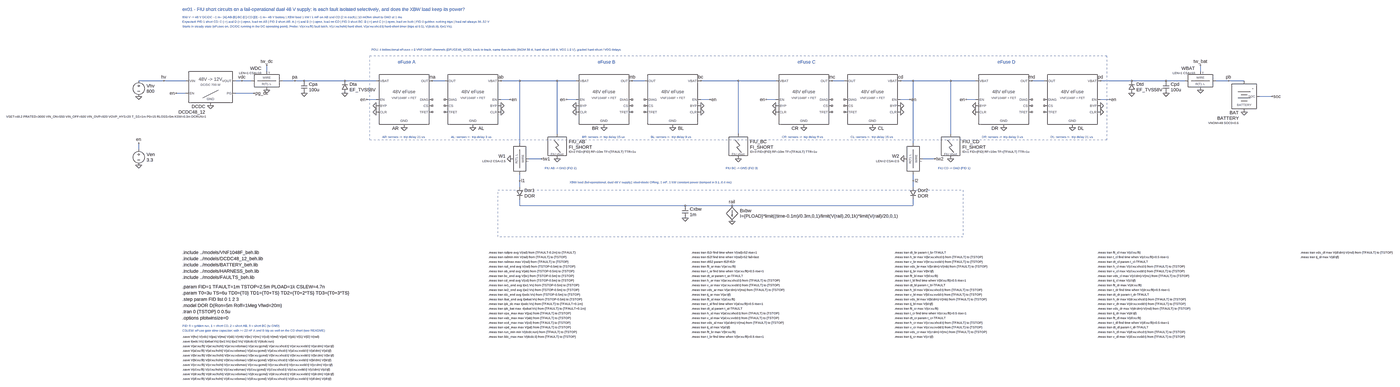
[diagram p0: schematic ex01_fiu_short_selectivity.asc, whole sheet]
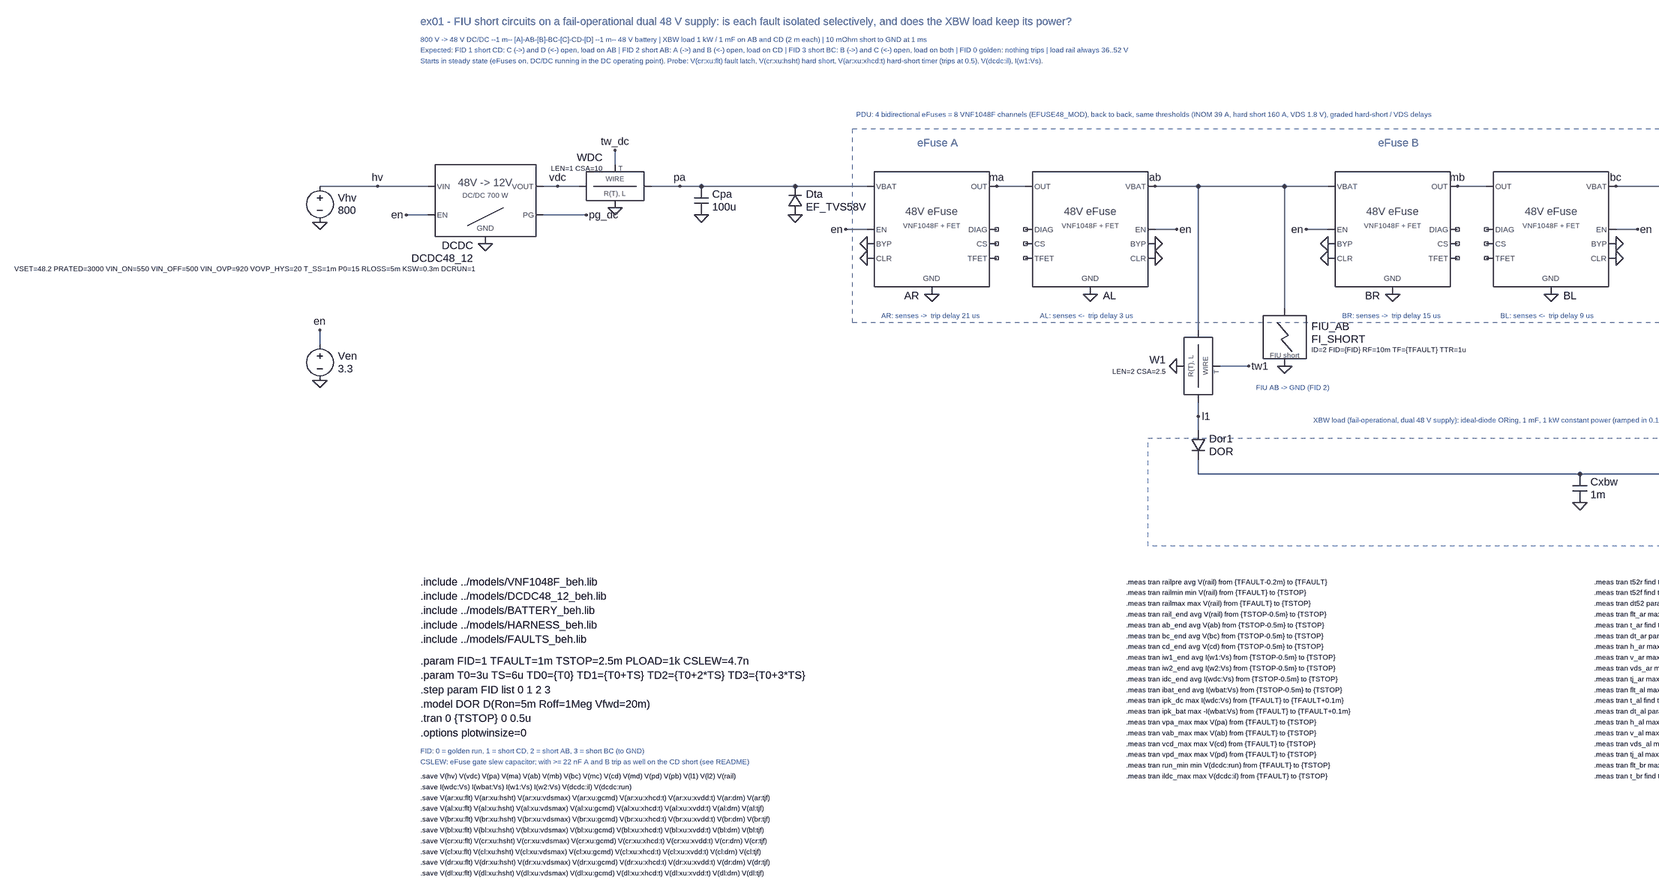
[diagram p1: schematic ex01_fiu_short_selectivity.asc, part, row 1 of 1, column 1 of 2]
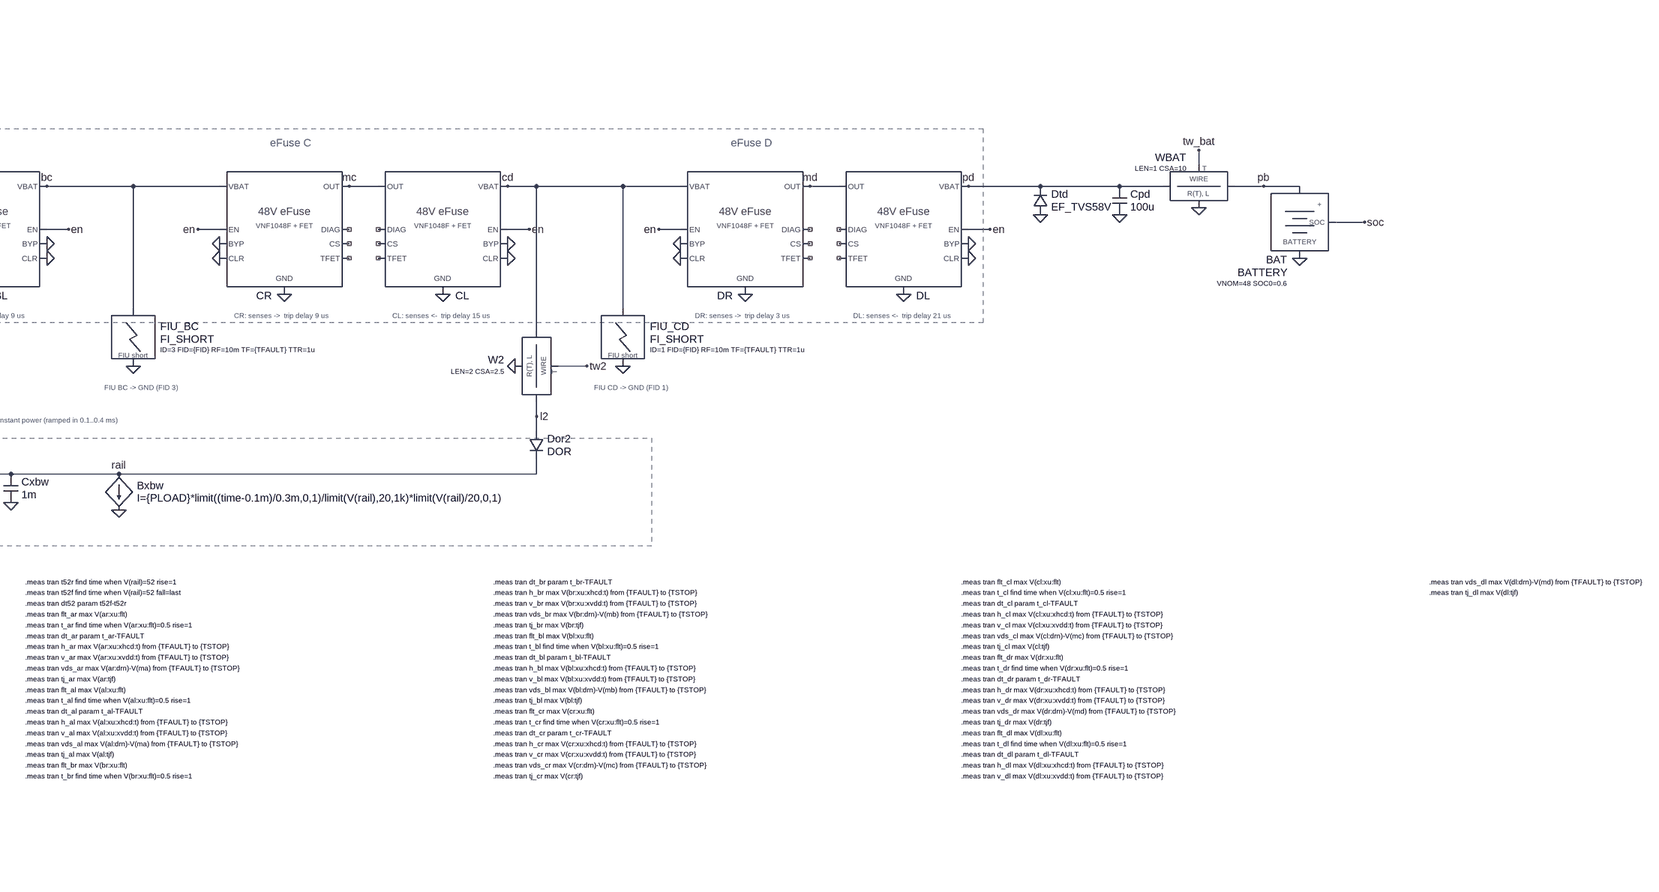
[diagram p2: schematic ex01_fiu_short_selectivity.asc, part, row 1 of 1, column 2 of 2]
ex01_fiu_short_selectivity.asc, the LTspice schematic file:
Version 4
SHEET 1 5600 1900
SYMBOL voltage -192 304 R0
WINDOW 0 40 42 Left 2
WINDOW 3 40 70 Left 2
SYMATTR InstName Vhv
SYMATTR Value 800
SYMATTR SpiceLine Rser=50m
FLAG -192 400 0
SYMBOL DCDC48_12 176 352 R0
SYMATTR InstName DCDC
SYMATTR SpiceLine VSET=48.2 PRATED=3000 VIN_ON=550 VIN_OFF=500 VIN_OVP=920 VOVP_HYS=20 T_SS=1m P0=15 RLOSS=5m KSW=0.3m DCRUN=1
WIRE -192 320 -64 320
WIRE -64 320 48 320
FLAG -64 320 hv
FLAG 176 448 0
WIRE 48 384 0 384
FLAG 0 384 en
WIRE 304 384 400 384
FLAG 400 384 pg_dc
SYMBOL WIRE 464 320 R0
SYMATTR InstName WDC
SYMATTR SpiceLine LEN=1 CSA=10
WINDOW 0 -28 -64 Right 2
WINDOW 3 0 0 Invisible 2
WINDOW 39 -28 -40 Right 1
WIRE 304 320 336 320
WIRE 336 320 384 320
FLAG 336 320 vdc
WIRE 464 272 464 240
FLAG 464 240 tw_dc
FLAG 464 368 0
SYMBOL cap 640 320 R0
WINDOW 0 40 18 Left 2
WINDOW 3 40 46 Left 2
SYMATTR InstName Cpa
SYMATTR Value 100u
SYMATTR SpiceLine Rser=30m
FLAG 656 384 0
SYMBOL diode 880 384 R180
WINDOW 0 -8 46 Right 2
WINDOW 3 -8 18 Right 2
SYMATTR InstName Dta
SYMATTR Value EF_TVS58V
FLAG 864 384 0
WIRE 544 320 608 320
WIRE 608 320 656 320
FLAG 608 320 pa
WIRE 656 320 864 320
SYMBOL EFUSE48_MOD 1168 416 R0
SYMATTR InstName AR
SYMATTR SpiceLine OVC_CODE=22 HSC_CODE=15 VDS_CODE=30 C_SLEW={CSLEW} HSC_DLY={TD3} VDS_DLY={TD3}
WINDOW 39 0 0 Invisible 2
WINDOW 3 0 0 Invisible 2
FLAG 1168 560 0
WIRE 1024 416 976 416
FLAG 976 416 en
FLAG 1024 448 0
FLAG 1024 480 0
TEXT 1056 608 Left 1 ;AR: senses ->  trip delay 21 us
SYMBOL EFUSE48_MOD 1520 416 M0
SYMATTR InstName AL
SYMATTR SpiceLine OVC_CODE=22 HSC_CODE=15 VDS_CODE=30 C_SLEW={CSLEW} HSC_DLY={TD0} VDS_DLY={TD0}
WINDOW 39 0 0 Invisible 2
WINDOW 3 0 0 Invisible 2
FLAG 1520 560 0
WIRE 1664 416 1712 416
FLAG 1712 416 en
FLAG 1664 448 0
FLAG 1664 480 0
TEXT 1408 608 Left 1 ;AL: senses <-  trip delay 3 us
WIRE 1312 320 1376 320
FLAG 1312 320 ma
WIRE 864 320 1024 320
FLAG 1664 320 ab
TEXT 1136 224 Left 2 ;eFuse A
SYMBOL EFUSE48_MOD 2192 416 R0
SYMATTR InstName BR
SYMATTR SpiceLine OVC_CODE=22 HSC_CODE=15 VDS_CODE=30 C_SLEW={CSLEW} HSC_DLY={TD2} VDS_DLY={TD2}
WINDOW 39 0 0 Invisible 2
WINDOW 3 0 0 Invisible 2
FLAG 2192 560 0
WIRE 2048 416 2000 416
FLAG 2000 416 en
FLAG 2048 448 0
FLAG 2048 480 0
TEXT 2080 608 Left 1 ;BR: senses ->  trip delay 15 us
SYMBOL EFUSE48_MOD 2544 416 M0
SYMATTR InstName BL
SYMATTR SpiceLine OVC_CODE=22 HSC_CODE=15 VDS_CODE=30 C_SLEW={CSLEW} HSC_DLY={TD1} VDS_DLY={TD1}
WINDOW 39 0 0 Invisible 2
WINDOW 3 0 0 Invisible 2
FLAG 2544 560 0
WIRE 2688 416 2736 416
FLAG 2736 416 en
FLAG 2688 448 0
FLAG 2688 480 0
TEXT 2432 608 Left 1 ;BL: senses <-  trip delay 9 us
WIRE 2336 320 2400 320
FLAG 2336 320 mb
WIRE 1664 320 2048 320
FLAG 2688 320 bc
TEXT 2160 224 Left 2 ;eFuse B
SYMBOL EFUSE48_MOD 3216 416 R0
SYMATTR InstName CR
SYMATTR SpiceLine OVC_CODE=22 HSC_CODE=15 VDS_CODE=30 C_SLEW={CSLEW} HSC_DLY={TD1} VDS_DLY={TD1}
WINDOW 39 0 0 Invisible 2
WINDOW 3 0 0 Invisible 2
FLAG 3216 560 0
WIRE 3072 416 3024 416
FLAG 3024 416 en
FLAG 3072 448 0
FLAG 3072 480 0
TEXT 3104 608 Left 1 ;CR: senses ->  trip delay 9 us
SYMBOL EFUSE48_MOD 3568 416 M0
SYMATTR InstName CL
SYMATTR SpiceLine OVC_CODE=22 HSC_CODE=15 VDS_CODE=30 C_SLEW={CSLEW} HSC_DLY={TD2} VDS_DLY={TD2}
WINDOW 39 0 0 Invisible 2
WINDOW 3 0 0 Invisible 2
FLAG 3568 560 0
WIRE 3712 416 3760 416
FLAG 3760 416 en
FLAG 3712 448 0
FLAG 3712 480 0
TEXT 3456 608 Left 1 ;CL: senses <-  trip delay 15 us
WIRE 3360 320 3424 320
FLAG 3360 320 mc
WIRE 2688 320 3072 320
FLAG 3712 320 cd
TEXT 3184 224 Left 2 ;eFuse C
SYMBOL EFUSE48_MOD 4240 416 R0
SYMATTR InstName DR
SYMATTR SpiceLine OVC_CODE=22 HSC_CODE=15 VDS_CODE=30 C_SLEW={CSLEW} HSC_DLY={TD0} VDS_DLY={TD0}
WINDOW 39 0 0 Invisible 2
WINDOW 3 0 0 Invisible 2
FLAG 4240 560 0
WIRE 4096 416 4048 416
FLAG 4048 416 en
FLAG 4096 448 0
FLAG 4096 480 0
TEXT 4128 608 Left 1 ;DR: senses ->  trip delay 3 us
SYMBOL EFUSE48_MOD 4592 416 M0
SYMATTR InstName DL
SYMATTR SpiceLine OVC_CODE=22 HSC_CODE=15 VDS_CODE=30 C_SLEW={CSLEW} HSC_DLY={TD3} VDS_DLY={TD3}
WINDOW 39 0 0 Invisible 2
WINDOW 3 0 0 Invisible 2
FLAG 4592 560 0
WIRE 4736 416 4784 416
FLAG 4784 416 en
FLAG 4736 448 0
FLAG 4736 480 0
TEXT 4480 608 Left 1 ;DL: senses <-  trip delay 21 us
WIRE 4384 320 4448 320
FLAG 4384 320 md
WIRE 3712 320 4096 320
FLAG 4736 320 pd
TEXT 4208 224 Left 2 ;eFuse D
WIRE 4736 320 4864 320
RECTANGLE Normal 4768 624 992 192 2
TEXT 1000 160 Left 1 ;PDU: 4 bidirectional eFuses = 8 VNF1048F channels (EFUSE48_MOD), back to back, same thresholds (INOM 39 A, hard short 160 A, VDS 1.8 V), graded hard-short / VDS delays
SYMBOL diode 4912 384 R180
WINDOW 0 -8 46 Right 2
WINDOW 3 -8 18 Right 2
SYMATTR InstName Dtd
SYMATTR Value EF_TVS58V
FLAG 4896 384 0
SYMBOL cap 5056 320 R0
WINDOW 0 40 18 Left 2
WINDOW 3 40 46 Left 2
SYMATTR InstName Cpd
SYMATTR Value 100u
SYMATTR SpiceLine Rser=30m
FLAG 5072 384 0
SYMBOL WIRE 5248 320 R0
SYMATTR InstName WBAT
SYMATTR SpiceLine LEN=1 CSA=10
WINDOW 0 -28 -64 Right 2
WINDOW 3 0 0 Invisible 2
WINDOW 39 -28 -40 Right 1
WIRE 4864 320 4896 320
WIRE 4896 320 5072 320
WIRE 5072 320 5168 320
WIRE 5248 272 5248 240
FLAG 5248 240 tw_bat
FLAG 5248 368 0
SYMBOL BATTERY 5472 400 R0
SYMATTR InstName BAT
SYMATTR SpiceLine VNOM=48 SOC0=0.6
WIRE 5328 320 5392 320
WIRE 5392 320 5472 320
FLAG 5392 320 pb
FLAG 5472 480 0
WIRE 5552 400 5616 400
FLAG 5616 400 soc
WIRE 1760 320 1760 640
SYMBOL WIRE 1760 720 R90
SYMATTR InstName W1
SYMATTR SpiceLine LEN=2 CSA=2.5
WINDOW 0 -14 72 VRight 2
WINDOW 3 0 0 Invisible 2
WINDOW 39 12 72 VRight 1
WIRE 1808 720 1872 720
FLAG 1872 720 tw1
FLAG 1712 720 0
SYMBOL diode 1744 864 R0
WINDOW 0 40 18 Left 2
WINDOW 3 40 46 Left 2
SYMATTR InstName Dor1
SYMATTR Value DOR
WIRE 1760 800 1760 832
WIRE 1760 832 1760 864
FLAG 1760 832 l1
WIRE 3776 320 3776 640
SYMBOL WIRE 3776 720 R90
SYMATTR InstName W2
SYMATTR SpiceLine LEN=2 CSA=2.5
WINDOW 0 -14 72 VRight 2
WINDOW 3 0 0 Invisible 2
WINDOW 39 12 72 VRight 1
WIRE 3824 720 3888 720
FLAG 3888 720 tw2
FLAG 3728 720 0
SYMBOL diode 3760 864 R0
WINDOW 0 40 18 Left 2
WINDOW 3 40 46 Left 2
SYMATTR InstName Dor2
SYMATTR Value DOR
WIRE 3776 800 3776 832
WIRE 3776 832 3776 864
FLAG 3776 832 l2
WIRE 1760 928 1760 960
WIRE 1760 960 3776 960
WIRE 3776 960 3776 928
FLAG 2848 960 rail
SYMBOL cap 2592 960 R0
WINDOW 0 40 18 Left 2
WINDOW 3 40 46 Left 2
SYMATTR InstName Cxbw
SYMATTR Value 1m
SYMATTR SpiceLine Rser=10m
FLAG 2608 1024 0
SYMBOL bi 2848 960 R0
WINDOW 0 40 26 Left 2
WINDOW 3 40 54 Left 2
SYMATTR InstName Bxbw
SYMATTR Value I={PLOAD}*limit((time-0.1m)/0.3m,0,1)/limit(V(rail),20,1k)*limit(V(rail)/20,0,1)
FLAG 2848 1040 0
RECTANGLE Normal 4032 1120 1648 880 2
TEXT 2016 840 Left 1 ;XBW load (fail-operational, dual 48 V supply): ideal-diode ORing, 1 mF, 1 kW constant power (ramped in 0.1..0.4 ms)
WIRE 1952 320 1952 592
SYMBOL FI_SHORT 1952 656 R0
SYMATTR InstName FIU_AB
SYMATTR SpiceLine ID=2 FID={FID} RF=10m TF={TFAULT} TTR=1u
FLAG 1952 720 0
TEXT 1888 768 Left 1 ;FIU AB -> GND (FID 2)
WIRE 2880 320 2880 592
SYMBOL FI_SHORT 2880 656 R0
SYMATTR InstName FIU_BC
SYMATTR SpiceLine ID=3 FID={FID} RF=10m TF={TFAULT} TTR=1u
FLAG 2880 720 0
TEXT 2816 768 Left 1 ;FIU BC -> GND (FID 3)
WIRE 3968 320 3968 592
SYMBOL FI_SHORT 3968 656 R0
SYMATTR InstName FIU_CD
SYMATTR SpiceLine ID=1 FID={FID} RF=10m TF={TFAULT} TTR=1u
FLAG 3968 720 0
TEXT 3904 768 Left 1 ;FIU CD -> GND (FID 1)
SYMBOL voltage -192 656 R0
WINDOW 0 40 42 Left 2
WINDOW 3 40 70 Left 2
SYMATTR InstName Ven
SYMATTR Value 3.3
WIRE -192 672 -192 640
FLAG -192 640 en
FLAG -192 752 0
TEXT 32 -160 Left 2 ;ex01 - FIU short circuits on a fail-operational dual 48 V supply: is each fault isolated selectively, and does the XBW load keep its power?
TEXT 32 -120 Left 1 ;800 V -> 48 V DC/DC --1 m-- [A]-AB-[B]-BC-[C]-CD-[D] --1 m-- 48 V battery | XBW load 1 kW / 1 mF on AB and CD (2 m each) | 10 mOhm short to GND at 1 ms
TEXT 32 -96 Left 1 ;Expected: FID 1 short CD: C (->) and D (<-) open, load on AB | FID 2 short AB: A (->) and B (<-) open, load on CD | FID 3 short BC: B (->) and C (<-) open, load on both | FID 0 golden: nothing trips | load rail always 36..52 V
TEXT 32 -72 Left 1 ;Starts in steady state (eFuses on, DC/DC running in the DC operating point). Probe: V(cr:xu:flt) fault latch, V(cr:xu:hsht) hard short, V(ar:xu:xhcd:t) hard-short timer (trips at 0.5), V(dcdc:il), I(w1:Vs).
TEXT 32 1200 Left 2 !.include ../models/VNF1048F_beh.lib
TEXT 32 1232 Left 2 !.include ../models/DCDC48_12_beh.lib
TEXT 32 1264 Left 2 !.include ../models/BATTERY_beh.lib
TEXT 32 1296 Left 2 !.include ../models/HARNESS_beh.lib
TEXT 32 1328 Left 2 !.include ../models/FAULTS_beh.lib
TEXT 32 1376 Left 2 !.param FID=1 TFAULT=1m TSTOP=2.5m PLOAD=1k CSLEW=4.7n
TEXT 32 1408 Left 2 !.param T0=3u TS=6u TD0={T0} TD1={T0+TS} TD2={T0+2*TS} TD3={T0+3*TS}
TEXT 32 1440 Left 2 !.step param FID list 0 1 2 3
TEXT 32 1472 Left 2 !.model DOR D(Ron=5m Roff=1Meg Vfwd=20m)
TEXT 32 1504 Left 2 !.tran 0 {TSTOP} 0 0.5u
TEXT 32 1536 Left 2 !.options plotwinsize=0
TEXT 32 1576 Left 1 ;FID: 0 = golden run, 1 = short CD, 2 = short AB, 3 = short BC (to GND)
TEXT 32 1600 Left 1 ;CSLEW: eFuse gate slew capacitor; with >= 22 nF A and B trip as well on the CD short (see README)
TEXT 1600 1200 Left 1 !.meas tran railpre avg V(rail) from {TFAULT-0.2m} to {TFAULT}
TEXT 1600 1224 Left 1 !.meas tran railmin min V(rail) from {TFAULT} to {TSTOP}
TEXT 1600 1248 Left 1 !.meas tran railmax max V(rail) from {TFAULT} to {TSTOP}
TEXT 1600 1272 Left 1 !.meas tran rail_end avg V(rail) from {TSTOP-0.5m} to {TSTOP}
TEXT 1600 1296 Left 1 !.meas tran ab_end avg V(ab) from {TSTOP-0.5m} to {TSTOP}
TEXT 1600 1320 Left 1 !.meas tran bc_end avg V(bc) from {TSTOP-0.5m} to {TSTOP}
TEXT 1600 1344 Left 1 !.meas tran cd_end avg V(cd) from {TSTOP-0.5m} to {TSTOP}
TEXT 1600 1368 Left 1 !.meas tran iw1_end avg I(w1:Vs) from {TSTOP-0.5m} to {TSTOP}
TEXT 1600 1392 Left 1 !.meas tran iw2_end avg I(w2:Vs) from {TSTOP-0.5m} to {TSTOP}
TEXT 1600 1416 Left 1 !.meas tran idc_end avg I(wdc:Vs) from {TSTOP-0.5m} to {TSTOP}
TEXT 1600 1440 Left 1 !.meas tran ibat_end avg I(wbat:Vs) from {TSTOP-0.5m} to {TSTOP}
TEXT 1600 1464 Left 1 !.meas tran ipk_dc max I(wdc:Vs) from {TFAULT} to {TFAULT+0.1m}
TEXT 1600 1488 Left 1 !.meas tran ipk_bat max -I(wbat:Vs) from {TFAULT} to {TFAULT+0.1m}
TEXT 1600 1512 Left 1 !.meas tran vpa_max max V(pa) from {TFAULT} to {TSTOP}
TEXT 1600 1536 Left 1 !.meas tran vab_max max V(ab) from {TFAULT} to {TSTOP}
TEXT 1600 1560 Left 1 !.meas tran vcd_max max V(cd) from {TFAULT} to {TSTOP}
TEXT 1600 1584 Left 1 !.meas tran vpd_max max V(pd) from {TFAULT} to {TSTOP}
TEXT 1600 1608 Left 1 !.meas tran run_min min V(dcdc:run) from {TFAULT} to {TSTOP}
TEXT 1600 1632 Left 1 !.meas tran ildc_max max V(dcdc:il) from {TFAULT} to {TSTOP}
TEXT 2640 1200 Left 1 !.meas tran t52r find time when V(rail)=52 rise=1
TEXT 2640 1224 Left 1 !.meas tran t52f find time when V(rail)=52 fall=last
TEXT 2640 1248 Left 1 !.meas tran dt52 param t52f-t52r
TEXT 2640 1272 Left 1 !.meas tran flt_ar max V(ar:xu:flt)
TEXT 2640 1296 Left 1 !.meas tran t_ar find time when V(ar:xu:flt)=0.5 rise=1
TEXT 2640 1320 Left 1 !.meas tran dt_ar param t_ar-TFAULT
TEXT 2640 1344 Left 1 !.meas tran h_ar max V(ar:xu:xhcd:t) from {TFAULT} to {TSTOP}
TEXT 2640 1368 Left 1 !.meas tran v_ar max V(ar:xu:xvdd:t) from {TFAULT} to {TSTOP}
TEXT 2640 1392 Left 1 !.meas tran vds_ar max V(ar:drn)-V(ma) from {TFAULT} to {TSTOP}
TEXT 2640 1416 Left 1 !.meas tran tj_ar max V(ar:tjf)
TEXT 2640 1440 Left 1 !.meas tran flt_al max V(al:xu:flt)
TEXT 2640 1464 Left 1 !.meas tran t_al find time when V(al:xu:flt)=0.5 rise=1
TEXT 2640 1488 Left 1 !.meas tran dt_al param t_al-TFAULT
TEXT 2640 1512 Left 1 !.meas tran h_al max V(al:xu:xhcd:t) from {TFAULT} to {TSTOP}
TEXT 2640 1536 Left 1 !.meas tran v_al max V(al:xu:xvdd:t) from {TFAULT} to {TSTOP}
TEXT 2640 1560 Left 1 !.meas tran vds_al max V(al:drn)-V(ma) from {TFAULT} to {TSTOP}
TEXT 2640 1584 Left 1 !.meas tran tj_al max V(al:tjf)
TEXT 2640 1608 Left 1 !.meas tran flt_br max V(br:xu:flt)
TEXT 2640 1632 Left 1 !.meas tran t_br find time when V(br:xu:flt)=0.5 rise=1
TEXT 3680 1200 Left 1 !.meas tran dt_br param t_br-TFAULT
TEXT 3680 1224 Left 1 !.meas tran h_br max V(br:xu:xhcd:t) from {TFAULT} to {TSTOP}
TEXT 3680 1248 Left 1 !.meas tran v_br max V(br:xu:xvdd:t) from {TFAULT} to {TSTOP}
TEXT 3680 1272 Left 1 !.meas tran vds_br max V(br:drn)-V(mb) from {TFAULT} to {TSTOP}
TEXT 3680 1296 Left 1 !.meas tran tj_br max V(br:tjf)
TEXT 3680 1320 Left 1 !.meas tran flt_bl max V(bl:xu:flt)
TEXT 3680 1344 Left 1 !.meas tran t_bl find time when V(bl:xu:flt)=0.5 rise=1
TEXT 3680 1368 Left 1 !.meas tran dt_bl param t_bl-TFAULT
TEXT 3680 1392 Left 1 !.meas tran h_bl max V(bl:xu:xhcd:t) from {TFAULT} to {TSTOP}
TEXT 3680 1416 Left 1 !.meas tran v_bl max V(bl:xu:xvdd:t) from {TFAULT} to {TSTOP}
TEXT 3680 1440 Left 1 !.meas tran vds_bl max V(bl:drn)-V(mb) from {TFAULT} to {TSTOP}
TEXT 3680 1464 Left 1 !.meas tran tj_bl max V(bl:tjf)
TEXT 3680 1488 Left 1 !.meas tran flt_cr max V(cr:xu:flt)
TEXT 3680 1512 Left 1 !.meas tran t_cr find time when V(cr:xu:flt)=0.5 rise=1
TEXT 3680 1536 Left 1 !.meas tran dt_cr param t_cr-TFAULT
TEXT 3680 1560 Left 1 !.meas tran h_cr max V(cr:xu:xhcd:t) from {TFAULT} to {TSTOP}
TEXT 3680 1584 Left 1 !.meas tran v_cr max V(cr:xu:xvdd:t) from {TFAULT} to {TSTOP}
TEXT 3680 1608 Left 1 !.meas tran vds_cr max V(cr:drn)-V(mc) from {TFAULT} to {TSTOP}
TEXT 3680 1632 Left 1 !.meas tran tj_cr max V(cr:tjf)
TEXT 4720 1200 Left 1 !.meas tran flt_cl max V(cl:xu:flt)
TEXT 4720 1224 Left 1 !.meas tran t_cl find time when V(cl:xu:flt)=0.5 rise=1
TEXT 4720 1248 Left 1 !.meas tran dt_cl param t_cl-TFAULT
TEXT 4720 1272 Left 1 !.meas tran h_cl max V(cl:xu:xhcd:t) from {TFAULT} to {TSTOP}
TEXT 4720 1296 Left 1 !.meas tran v_cl max V(cl:xu:xvdd:t) from {TFAULT} to {TSTOP}
TEXT 4720 1320 Left 1 !.meas tran vds_cl max V(cl:drn)-V(mc) from {TFAULT} to {TSTOP}
TEXT 4720 1344 Left 1 !.meas tran tj_cl max V(cl:tjf)
TEXT 4720 1368 Left 1 !.meas tran flt_dr max V(dr:xu:flt)
TEXT 4720 1392 Left 1 !.meas tran t_dr find time when V(dr:xu:flt)=0.5 rise=1
TEXT 4720 1416 Left 1 !.meas tran dt_dr param t_dr-TFAULT
TEXT 4720 1440 Left 1 !.meas tran h_dr max V(dr:xu:xhcd:t) from {TFAULT} to {TSTOP}
TEXT 4720 1464 Left 1 !.meas tran v_dr max V(dr:xu:xvdd:t) from {TFAULT} to {TSTOP}
TEXT 4720 1488 Left 1 !.meas tran vds_dr max V(dr:drn)-V(md) from {TFAULT} to {TSTOP}
TEXT 4720 1512 Left 1 !.meas tran tj_dr max V(dr:tjf)
TEXT 4720 1536 Left 1 !.meas tran flt_dl max V(dl:xu:flt)
TEXT 4720 1560 Left 1 !.meas tran t_dl find time when V(dl:xu:flt)=0.5 rise=1
TEXT 4720 1584 Left 1 !.meas tran dt_dl param t_dl-TFAULT
TEXT 4720 1608 Left 1 !.meas tran h_dl max V(dl:xu:xhcd:t) from {TFAULT} to {TSTOP}
TEXT 4720 1632 Left 1 !.meas tran v_dl max V(dl:xu:xvdd:t) from {TFAULT} to {TSTOP}
TEXT 5760 1200 Left 1 !.meas tran vds_dl max V(dl:drn)-V(md) from {TFAULT} to {TSTOP}
TEXT 5760 1224 Left 1 !.meas tran tj_dl max V(dl:tjf)
TEXT 32 1632 Left 1 !.save V(hv) V(vdc) V(pa) V(ma) V(ab) V(mb) V(bc) V(mc) V(cd) V(md) V(pd) V(pb) V(l1) V(l2) V(rail)
TEXT 32 1656 Left 1 !.save I(wdc:Vs) I(wbat:Vs) I(w1:Vs) I(w2:Vs) V(dcdc:il) V(dcdc:run)
TEXT 32 1680 Left 1 !.save V(ar:xu:flt) V(ar:xu:hsht) V(ar:xu:vdsmax) V(ar:xu:gcmd) V(ar:xu:xhcd:t) V(ar:xu:xvdd:t) V(ar:drn) V(ar:tjf)
TEXT 32 1704 Left 1 !.save V(al:xu:flt) V(al:xu:hsht) V(al:xu:vdsmax) V(al:xu:gcmd) V(al:xu:xhcd:t) V(al:xu:xvdd:t) V(al:drn) V(al:tjf)
TEXT 32 1728 Left 1 !.save V(br:xu:flt) V(br:xu:hsht) V(br:xu:vdsmax) V(br:xu:gcmd) V(br:xu:xhcd:t) V(br:xu:xvdd:t) V(br:drn) V(br:tjf)
TEXT 32 1752 Left 1 !.save V(bl:xu:flt) V(bl:xu:hsht) V(bl:xu:vdsmax) V(bl:xu:gcmd) V(bl:xu:xhcd:t) V(bl:xu:xvdd:t) V(bl:drn) V(bl:tjf)
TEXT 32 1776 Left 1 !.save V(cr:xu:flt) V(cr:xu:hsht) V(cr:xu:vdsmax) V(cr:xu:gcmd) V(cr:xu:xhcd:t) V(cr:xu:xvdd:t) V(cr:drn) V(cr:tjf)
TEXT 32 1800 Left 1 !.save V(cl:xu:flt) V(cl:xu:hsht) V(cl:xu:vdsmax) V(cl:xu:gcmd) V(cl:xu:xhcd:t) V(cl:xu:xvdd:t) V(cl:drn) V(cl:tjf)
TEXT 32 1824 Left 1 !.save V(dr:xu:flt) V(dr:xu:hsht) V(dr:xu:vdsmax) V(dr:xu:gcmd) V(dr:xu:xhcd:t) V(dr:xu:xvdd:t) V(dr:drn) V(dr:tjf)
TEXT 32 1848 Left 1 !.save V(dl:xu:flt) V(dl:xu:hsht) V(dl:xu:vdsmax) V(dl:xu:gcmd) V(dl:xu:xhcd:t) V(dl:xu:xvdd:t) V(dl:drn) V(dl:tjf)

The netlist it stands for:
* ex01_fiu_short_selectivity.asc
Vhv hv 0 800 Rser=50m
XDCDC hv vdc 0 en pg_dc DCDC48_12 VSET=48.2 PRATED=3000 VIN_ON=550 VIN_OFF=500 VIN_OVP=920 VOVP_HYS=20 T_SS=1m P0=15 RLOSS=5m KSW=0.3m DCRUN=1  ; pins VIN VOUT GND EN PG
XWDC vdc pa tw_dc 0 WIRE LEN=1 CSA=10  ; pins A B T GND
Cpa pa 0 100u Rser=30m
Dta 0 pa EF_TVS58V
XAR pa ma 0 en 0 0 NC_01 NC_02 NC_03 EFUSE48_MOD OVC_CODE=22 HSC_CODE=15 VDS_CODE=30 C_SLEW={CSLEW} HSC_DLY={TD3} VDS_DLY={TD3}  ; pins VBAT OUT GND EN BYP CLR DIAG CS TFET
XAL ab ma 0 en 0 0 NC_04 NC_05 NC_06 EFUSE48_MOD OVC_CODE=22 HSC_CODE=15 VDS_CODE=30 C_SLEW={CSLEW} HSC_DLY={TD0} VDS_DLY={TD0}  ; pins VBAT OUT GND EN BYP CLR DIAG CS TFET
XBR ab mb 0 en 0 0 NC_07 NC_08 NC_09 EFUSE48_MOD OVC_CODE=22 HSC_CODE=15 VDS_CODE=30 C_SLEW={CSLEW} HSC_DLY={TD2} VDS_DLY={TD2}  ; pins VBAT OUT GND EN BYP CLR DIAG CS TFET
XBL bc mb 0 en 0 0 NC_10 NC_11 NC_12 EFUSE48_MOD OVC_CODE=22 HSC_CODE=15 VDS_CODE=30 C_SLEW={CSLEW} HSC_DLY={TD1} VDS_DLY={TD1}  ; pins VBAT OUT GND EN BYP CLR DIAG CS TFET
XCR bc mc 0 en 0 0 NC_13 NC_14 NC_15 EFUSE48_MOD OVC_CODE=22 HSC_CODE=15 VDS_CODE=30 C_SLEW={CSLEW} HSC_DLY={TD1} VDS_DLY={TD1}  ; pins VBAT OUT GND EN BYP CLR DIAG CS TFET
XCL cd mc 0 en 0 0 NC_16 NC_17 NC_18 EFUSE48_MOD OVC_CODE=22 HSC_CODE=15 VDS_CODE=30 C_SLEW={CSLEW} HSC_DLY={TD2} VDS_DLY={TD2}  ; pins VBAT OUT GND EN BYP CLR DIAG CS TFET
XDR cd md 0 en 0 0 NC_19 NC_20 NC_21 EFUSE48_MOD OVC_CODE=22 HSC_CODE=15 VDS_CODE=30 C_SLEW={CSLEW} HSC_DLY={TD0} VDS_DLY={TD0}  ; pins VBAT OUT GND EN BYP CLR DIAG CS TFET
XDL pd md 0 en 0 0 NC_22 NC_23 NC_24 EFUSE48_MOD OVC_CODE=22 HSC_CODE=15 VDS_CODE=30 C_SLEW={CSLEW} HSC_DLY={TD3} VDS_DLY={TD3}  ; pins VBAT OUT GND EN BYP CLR DIAG CS TFET
Dtd 0 pd EF_TVS58V
Cpd pd 0 100u Rser=30m
XWBAT pd pb tw_bat 0 WIRE LEN=1 CSA=10  ; pins A B T GND
XBAT pb 0 soc BATTERY VNOM=48 SOC0=0.6  ; pins P N SOC
XW1 ab l1 tw1 0 WIRE LEN=2 CSA=2.5  ; pins A B T GND
Dor1 l1 rail DOR
XW2 cd l2 tw2 0 WIRE LEN=2 CSA=2.5  ; pins A B T GND
Dor2 l2 rail DOR
Cxbw rail 0 1m Rser=10m
Bxbw rail 0 I={PLOAD}*limit((time-0.1m)/0.3m,0,1)/limit(V(rail),20,1k)*limit(V(rail)/20,0,1)
XFIU_AB ab 0 FI_SHORT ID=2 FID={FID} RF=10m TF={TFAULT} TTR=1u  ; pins A B
XFIU_BC bc 0 FI_SHORT ID=3 FID={FID} RF=10m TF={TFAULT} TTR=1u  ; pins A B
XFIU_CD cd 0 FI_SHORT ID=1 FID={FID} RF=10m TF={TFAULT} TTR=1u  ; pins A B
Ven en 0 3.3
.model D D
.lib standard.dio
* AR: senses ->  trip delay 21 us
* AL: senses <-  trip delay 3 us
* eFuse A
* BR: senses ->  trip delay 15 us
* BL: senses <-  trip delay 9 us
* eFuse B
* CR: senses ->  trip delay 9 us
* CL: senses <-  trip delay 15 us
* eFuse C
* DR: senses ->  trip delay 3 us
* DL: senses <-  trip delay 21 us
* eFuse D
* PDU: 4 bidirectional eFuses = 8 VNF1048F channels (EFUSE48_MOD), back to back, same thresholds (INOM 39 A, hard short 160 A, VDS 1.8 V), graded hard-short / VDS delays
* XBW load (fail-operational, dual 48 V supply): ideal-diode ORing, 1 mF, 1 kW constant power (ramped in 0.1..0.4 ms)
* FIU AB -> GND (FID 2)
* FIU BC -> GND (FID 3)
* FIU CD -> GND (FID 1)
* ex01 - FIU short circuits on a fail-operational dual 48 V supply: is each fault isolated selectively, and does the XBW load keep its power?
* 800 V -> 48 V DC/DC --1 m-- [A]-AB-[B]-BC-[C]-CD-[D] --1 m-- 48 V battery | XBW load 1 kW / 1 mF on AB and CD (2 m each) | 10 mOhm short to GND at 1 ms
* Expected: FID 1 short CD: C (->) and D (<-) open, load on AB | FID 2 short AB: A (->) and B (<-) open, load on CD | FID 3 short BC: B (->) and C (<-) open, load on both | FID 0 golden: nothing trips | load rail always 36..52 V
* Starts in steady state (eFuses on, DC/DC running in the DC operating point). Probe: V(cr:xu:flt) fault latch, V(cr:xu:hsht) hard short, V(ar:xu:xhcd:t) hard-short timer (trips at 0.5), V(dcdc:il), I(w1:Vs).
.include ../models/VNF1048F_beh.lib
.include ../models/DCDC48_12_beh.lib
.include ../models/BATTERY_beh.lib
.include ../models/HARNESS_beh.lib
.include ../models/FAULTS_beh.lib
.param FID=1 TFAULT=1m TSTOP=2.5m PLOAD=1k CSLEW=4.7n
.param T0=3u TS=6u TD0={T0} TD1={T0+TS} TD2={T0+2*TS} TD3={T0+3*TS}
.step param FID list 0 1 2 3
.model DOR D(Ron=5m Roff=1Meg Vfwd=20m)
.tran 0 {TSTOP} 0 0.5u
.options plotwinsize=0
* FID: 0 = golden run, 1 = short CD, 2 = short AB, 3 = short BC (to GND)
* CSLEW: eFuse gate slew capacitor; with >= 22 nF A and B trip as well on the CD short (see README)
.meas tran railpre avg V(rail) from {TFAULT-0.2m} to {TFAULT}
.meas tran railmin min V(rail) from {TFAULT} to {TSTOP}
.meas tran railmax max V(rail) from {TFAULT} to {TSTOP}
.meas tran rail_end avg V(rail) from {TSTOP-0.5m} to {TSTOP}
.meas tran ab_end avg V(ab) from {TSTOP-0.5m} to {TSTOP}
.meas tran bc_end avg V(bc) from {TSTOP-0.5m} to {TSTOP}
.meas tran cd_end avg V(cd) from {TSTOP-0.5m} to {TSTOP}
.meas tran iw1_end avg I(w1:Vs) from {TSTOP-0.5m} to {TSTOP}
.meas tran iw2_end avg I(w2:Vs) from {TSTOP-0.5m} to {TSTOP}
.meas tran idc_end avg I(wdc:Vs) from {TSTOP-0.5m} to {TSTOP}
.meas tran ibat_end avg I(wbat:Vs) from {TSTOP-0.5m} to {TSTOP}
.meas tran ipk_dc max I(wdc:Vs) from {TFAULT} to {TFAULT+0.1m}
.meas tran ipk_bat max -I(wbat:Vs) from {TFAULT} to {TFAULT+0.1m}
.meas tran vpa_max max V(pa) from {TFAULT} to {TSTOP}
.meas tran vab_max max V(ab) from {TFAULT} to {TSTOP}
.meas tran vcd_max max V(cd) from {TFAULT} to {TSTOP}
.meas tran vpd_max max V(pd) from {TFAULT} to {TSTOP}
.meas tran run_min min V(dcdc:run) from {TFAULT} to {TSTOP}
.meas tran ildc_max max V(dcdc:il) from {TFAULT} to {TSTOP}
.meas tran t52r find time when V(rail)=52 rise=1
.meas tran t52f find time when V(rail)=52 fall=last
.meas tran dt52 param t52f-t52r
.meas tran flt_ar max V(ar:xu:flt)
.meas tran t_ar find time when V(ar:xu:flt)=0.5 rise=1
.meas tran dt_ar param t_ar-TFAULT
.meas tran h_ar max V(ar:xu:xhcd:t) from {TFAULT} to {TSTOP}
.meas tran v_ar max V(ar:xu:xvdd:t) from {TFAULT} to {TSTOP}
.meas tran vds_ar max V(ar:drn)-V(ma) from {TFAULT} to {TSTOP}
.meas tran tj_ar max V(ar:tjf)
.meas tran flt_al max V(al:xu:flt)
.meas tran t_al find time when V(al:xu:flt)=0.5 rise=1
.meas tran dt_al param t_al-TFAULT
.meas tran h_al max V(al:xu:xhcd:t) from {TFAULT} to {TSTOP}
.meas tran v_al max V(al:xu:xvdd:t) from {TFAULT} to {TSTOP}
.meas tran vds_al max V(al:drn)-V(ma) from {TFAULT} to {TSTOP}
.meas tran tj_al max V(al:tjf)
.meas tran flt_br max V(br:xu:flt)
.meas tran t_br find time when V(br:xu:flt)=0.5 rise=1
.meas tran dt_br param t_br-TFAULT
.meas tran h_br max V(br:xu:xhcd:t) from {TFAULT} to {TSTOP}
.meas tran v_br max V(br:xu:xvdd:t) from {TFAULT} to {TSTOP}
.meas tran vds_br max V(br:drn)-V(mb) from {TFAULT} to {TSTOP}
.meas tran tj_br max V(br:tjf)
.meas tran flt_bl max V(bl:xu:flt)
.meas tran t_bl find time when V(bl:xu:flt)=0.5 rise=1
.meas tran dt_bl param t_bl-TFAULT
.meas tran h_bl max V(bl:xu:xhcd:t) from {TFAULT} to {TSTOP}
.meas tran v_bl max V(bl:xu:xvdd:t) from {TFAULT} to {TSTOP}
.meas tran vds_bl max V(bl:drn)-V(mb) from {TFAULT} to {TSTOP}
.meas tran tj_bl max V(bl:tjf)
.meas tran flt_cr max V(cr:xu:flt)
.meas tran t_cr find time when V(cr:xu:flt)=0.5 rise=1
.meas tran dt_cr param t_cr-TFAULT
.meas tran h_cr max V(cr:xu:xhcd:t) from {TFAULT} to {TSTOP}
.meas tran v_cr max V(cr:xu:xvdd:t) from {TFAULT} to {TSTOP}
.meas tran vds_cr max V(cr:drn)-V(mc) from {TFAULT} to {TSTOP}
.meas tran tj_cr max V(cr:tjf)
.meas tran flt_cl max V(cl:xu:flt)
.meas tran t_cl find time when V(cl:xu:flt)=0.5 rise=1
.meas tran dt_cl param t_cl-TFAULT
.meas tran h_cl max V(cl:xu:xhcd:t) from {TFAULT} to {TSTOP}
.meas tran v_cl max V(cl:xu:xvdd:t) from {TFAULT} to {TSTOP}
.meas tran vds_cl max V(cl:drn)-V(mc) from {TFAULT} to {TSTOP}
.meas tran tj_cl max V(cl:tjf)
.meas tran flt_dr max V(dr:xu:flt)
.meas tran t_dr find time when V(dr:xu:flt)=0.5 rise=1
.meas tran dt_dr param t_dr-TFAULT
.meas tran h_dr max V(dr:xu:xhcd:t) from {TFAULT} to {TSTOP}
.meas tran v_dr max V(dr:xu:xvdd:t) from {TFAULT} to {TSTOP}
.meas tran vds_dr max V(dr:drn)-V(md) from {TFAULT} to {TSTOP}
.meas tran tj_dr max V(dr:tjf)
.meas tran flt_dl max V(dl:xu:flt)
.meas tran t_dl find time when V(dl:xu:flt)=0.5 rise=1
.meas tran dt_dl param t_dl-TFAULT
.meas tran h_dl max V(dl:xu:xhcd:t) from {TFAULT} to {TSTOP}
.meas tran v_dl max V(dl:xu:xvdd:t) from {TFAULT} to {TSTOP}
.meas tran vds_dl max V(dl:drn)-V(md) from {TFAULT} to {TSTOP}
.meas tran tj_dl max V(dl:tjf)
.save V(hv) V(vdc) V(pa) V(ma) V(ab) V(mb) V(bc) V(mc) V(cd) V(md) V(pd) V(pb) V(l1) V(l2) V(rail)
.save I(wdc:Vs) I(wbat:Vs) I(w1:Vs) I(w2:Vs) V(dcdc:il) V(dcdc:run)
.save V(ar:xu:flt) V(ar:xu:hsht) V(ar:xu:vdsmax) V(ar:xu:gcmd) V(ar:xu:xhcd:t) V(ar:xu:xvdd:t) V(ar:drn) V(ar:tjf)
.save V(al:xu:flt) V(al:xu:hsht) V(al:xu:vdsmax) V(al:xu:gcmd) V(al:xu:xhcd:t) V(al:xu:xvdd:t) V(al:drn) V(al:tjf)
.save V(br:xu:flt) V(br:xu:hsht) V(br:xu:vdsmax) V(br:xu:gcmd) V(br:xu:xhcd:t) V(br:xu:xvdd:t) V(br:drn) V(br:tjf)
.save V(bl:xu:flt) V(bl:xu:hsht) V(bl:xu:vdsmax) V(bl:xu:gcmd) V(bl:xu:xhcd:t) V(bl:xu:xvdd:t) V(bl:drn) V(bl:tjf)
.save V(cr:xu:flt) V(cr:xu:hsht) V(cr:xu:vdsmax) V(cr:xu:gcmd) V(cr:xu:xhcd:t) V(cr:xu:xvdd:t) V(cr:drn) V(cr:tjf)
.save V(cl:xu:flt) V(cl:xu:hsht) V(cl:xu:vdsmax) V(cl:xu:gcmd) V(cl:xu:xhcd:t) V(cl:xu:xvdd:t) V(cl:drn) V(cl:tjf)
.save V(dr:xu:flt) V(dr:xu:hsht) V(dr:xu:vdsmax) V(dr:xu:gcmd) V(dr:xu:xhcd:t) V(dr:xu:xvdd:t) V(dr:drn) V(dr:tjf)
.save V(dl:xu:flt) V(dl:xu:hsht) V(dl:xu:vdsmax) V(dl:xu:gcmd) V(dl:xu:xhcd:t) V(dl:xu:xvdd:t) V(dl:drn) V(dl:tjf)
.backanno
.end